# Altium schematic sheet field_justification.SchDoc
size 254 x 203 mm
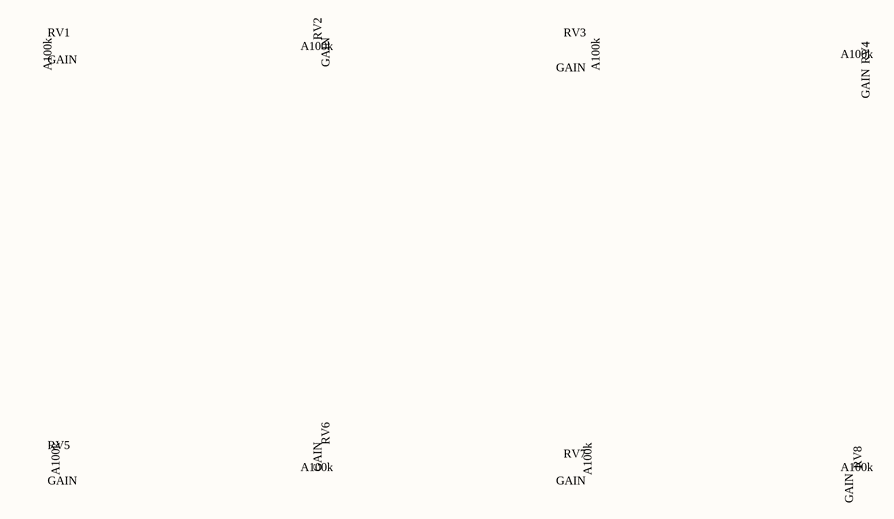
[diagram p0: field_justification.SchDoc]

## Parts
RV1  A100k  Function: GAIN
RV2  A100k  Function: GAIN
RV3  A100k  Function: GAIN
RV4  A100k  Function: GAIN
RV5  A100k  Function: GAIN
RV6  A100k  Function: GAIN
RV7  A100k  Function: GAIN
RV8  A100k  Function: GAIN

## Library data of the parts
RV1-RV8 = Potentiometer